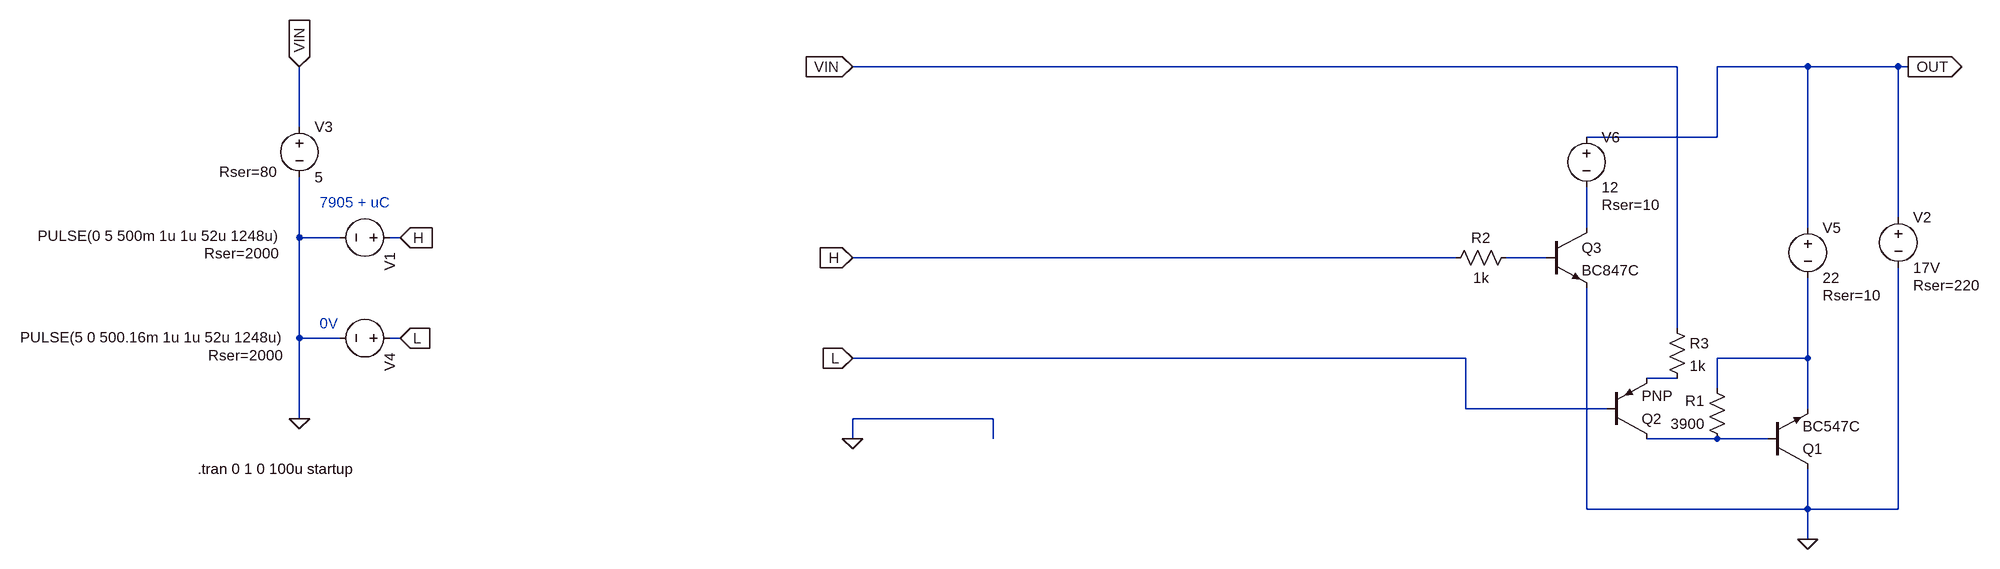
[diagram p0: schematic DriverB3.asc]
DriverB3.asc, the LTspice schematic file:
Version 4
SHEET 1 1772 804
WIRE 1280 16 -32 16
WIRE 1488 16 1344 16
WIRE 1632 16 1488 16
WIRE 1648 16 1632 16
WIRE -912 112 -912 16
WIRE 1344 128 1344 16
WIRE 1344 128 1136 128
WIRE 1632 256 1632 16
WIRE 1136 272 1136 208
WIRE 1488 272 1488 16
WIRE -912 288 -912 192
WIRE -848 288 -912 288
WIRE -752 288 -768 288
WIRE 928 320 -32 320
WIRE 1072 320 1008 320
WIRE 1280 432 1280 16
WIRE -912 448 -912 288
WIRE -848 448 -912 448
WIRE -752 448 -768 448
WIRE 944 480 -32 480
WIRE 1488 480 1488 352
WIRE 1488 480 1344 480
WIRE 1280 512 1232 512
WIRE 1344 528 1344 480
WIRE 944 560 944 480
WIRE 1168 560 944 560
WIRE 1488 560 1488 480
WIRE -912 576 -912 448
WIRE 192 576 -32 576
WIRE -32 608 -32 576
WIRE 192 608 192 576
WIRE 1344 608 1232 608
WIRE 1424 608 1344 608
WIRE 1136 720 1136 368
WIRE 1488 720 1488 656
WIRE 1488 720 1136 720
WIRE 1632 720 1632 336
WIRE 1632 720 1488 720
WIRE 1488 768 1488 720
FLAG 1648 16 OUT
IOPIN 1648 16 Out
FLAG -32 320 H
IOPIN -32 320 In
FLAG -32 480 L
IOPIN -32 480 In
FLAG -752 288 H
IOPIN -752 288 In
FLAG -752 448 L
IOPIN -752 448 In
FLAG -32 16 VIN
IOPIN -32 16 In
FLAG -912 16 VIN
IOPIN -912 16 In
FLAG 1488 768 0
FLAG -912 576 0
FLAG -32 608 0
SYMBOL voltage -752 288 R90
WINDOW 3 -3 192 VRight 2
WINDOW 123 0 0 Left 0
WINDOW 39 25 192 VRight 2
SYMATTR InstName V1
SYMATTR Value PULSE(0 5 500m 1u 1u 52u 1248u)
SYMATTR SpiceLine Rser=2000
SYMBOL voltage -912 96 R0
WINDOW 123 0 0 Left 0
WINDOW 39 -128 87 Left 2
SYMATTR InstName V3
SYMATTR Value 5
SYMATTR SpiceLine Rser=80
SYMBOL voltage -752 448 R90
WINDOW 3 -1 186 VRight 2
WINDOW 123 0 0 Left 0
WINDOW 39 27 186 VRight 2
SYMATTR InstName V4
SYMATTR Value PULSE(5 0 500.16m 1u 1u 52u 1248u)
SYMATTR SpiceLine Rser=2000
SYMBOL voltage 1632 240 R0
WINDOW 123 0 0 Left 0
WINDOW 39 24 124 Left 2
SYMATTR InstName V2
SYMATTR Value 17V
SYMATTR SpiceLine Rser=220
SYMBOL voltage 1488 256 R0
WINDOW 123 0 0 Left 0
WINDOW 39 24 124 Left 2
SYMATTR InstName V5
SYMATTR Value 22
SYMATTR SpiceLine Rser=10
SYMBOL voltage 1136 112 R0
WINDOW 123 0 0 Left 0
WINDOW 39 24 124 Left 2
SYMATTR InstName V6
SYMATTR Value 12
SYMATTR SpiceLine Rser=10
SYMBOL res 1024 304 R90
WINDOW 0 0 56 VBottom 2
WINDOW 3 32 56 VTop 2
SYMATTR InstName R2
SYMATTR Value 1k
SYMBOL npn 1424 656 M180
SYMATTR InstName Q1
SYMATTR Value BC547C
SYMBOL res 1360 624 R180
WINDOW 0 36 76 Left 2
WINDOW 3 36 40 Left 2
SYMATTR InstName R1
SYMATTR Value 3900
SYMBOL pnp 1168 608 M180
SYMATTR InstName Q2
SYMBOL res 1264 416 R0
SYMATTR InstName R3
SYMATTR Value 1k
SYMBOL npn 1072 272 R0
SYMATTR InstName Q3
SYMATTR Value BC847C
TEXT -1074 656 Left 2 !.tran 0 1 0 100u startup
TEXT -880 232 Left 2 ;7905 + uC
TEXT -880 424 Left 2 ;0V

The netlist it stands for:
* DriverB3.asc
V1 H 0 PULSE(0 5 500m 1u 1u 52u 1248u) Rser=2000
V3 VIN 0 5 Rser=80
V4 L 0 PULSE(5 0 500.16m 1u 1u 52u 1248u) Rser=2000
V2 OUT 0 17V Rser=220
V5 OUT N003 22 Rser=10
V6 OUT N001 12 Rser=10
R2 N002 H 1k
Q1 0 N005 N003 0 BC547C
R1 N005 N003 3900
Q2 N005 L N004 0 PNP
R3 VIN N004 1k
Q3 N001 N002 0 0 BC847C
.model NPN NPN
.model PNP PNP
.lib standard.bjt
.tran 0 1 0 100u startup
* 7905 + uC
* 0V
.backanno
.end